# Altium project BYTE_SPIne.PrjPcb
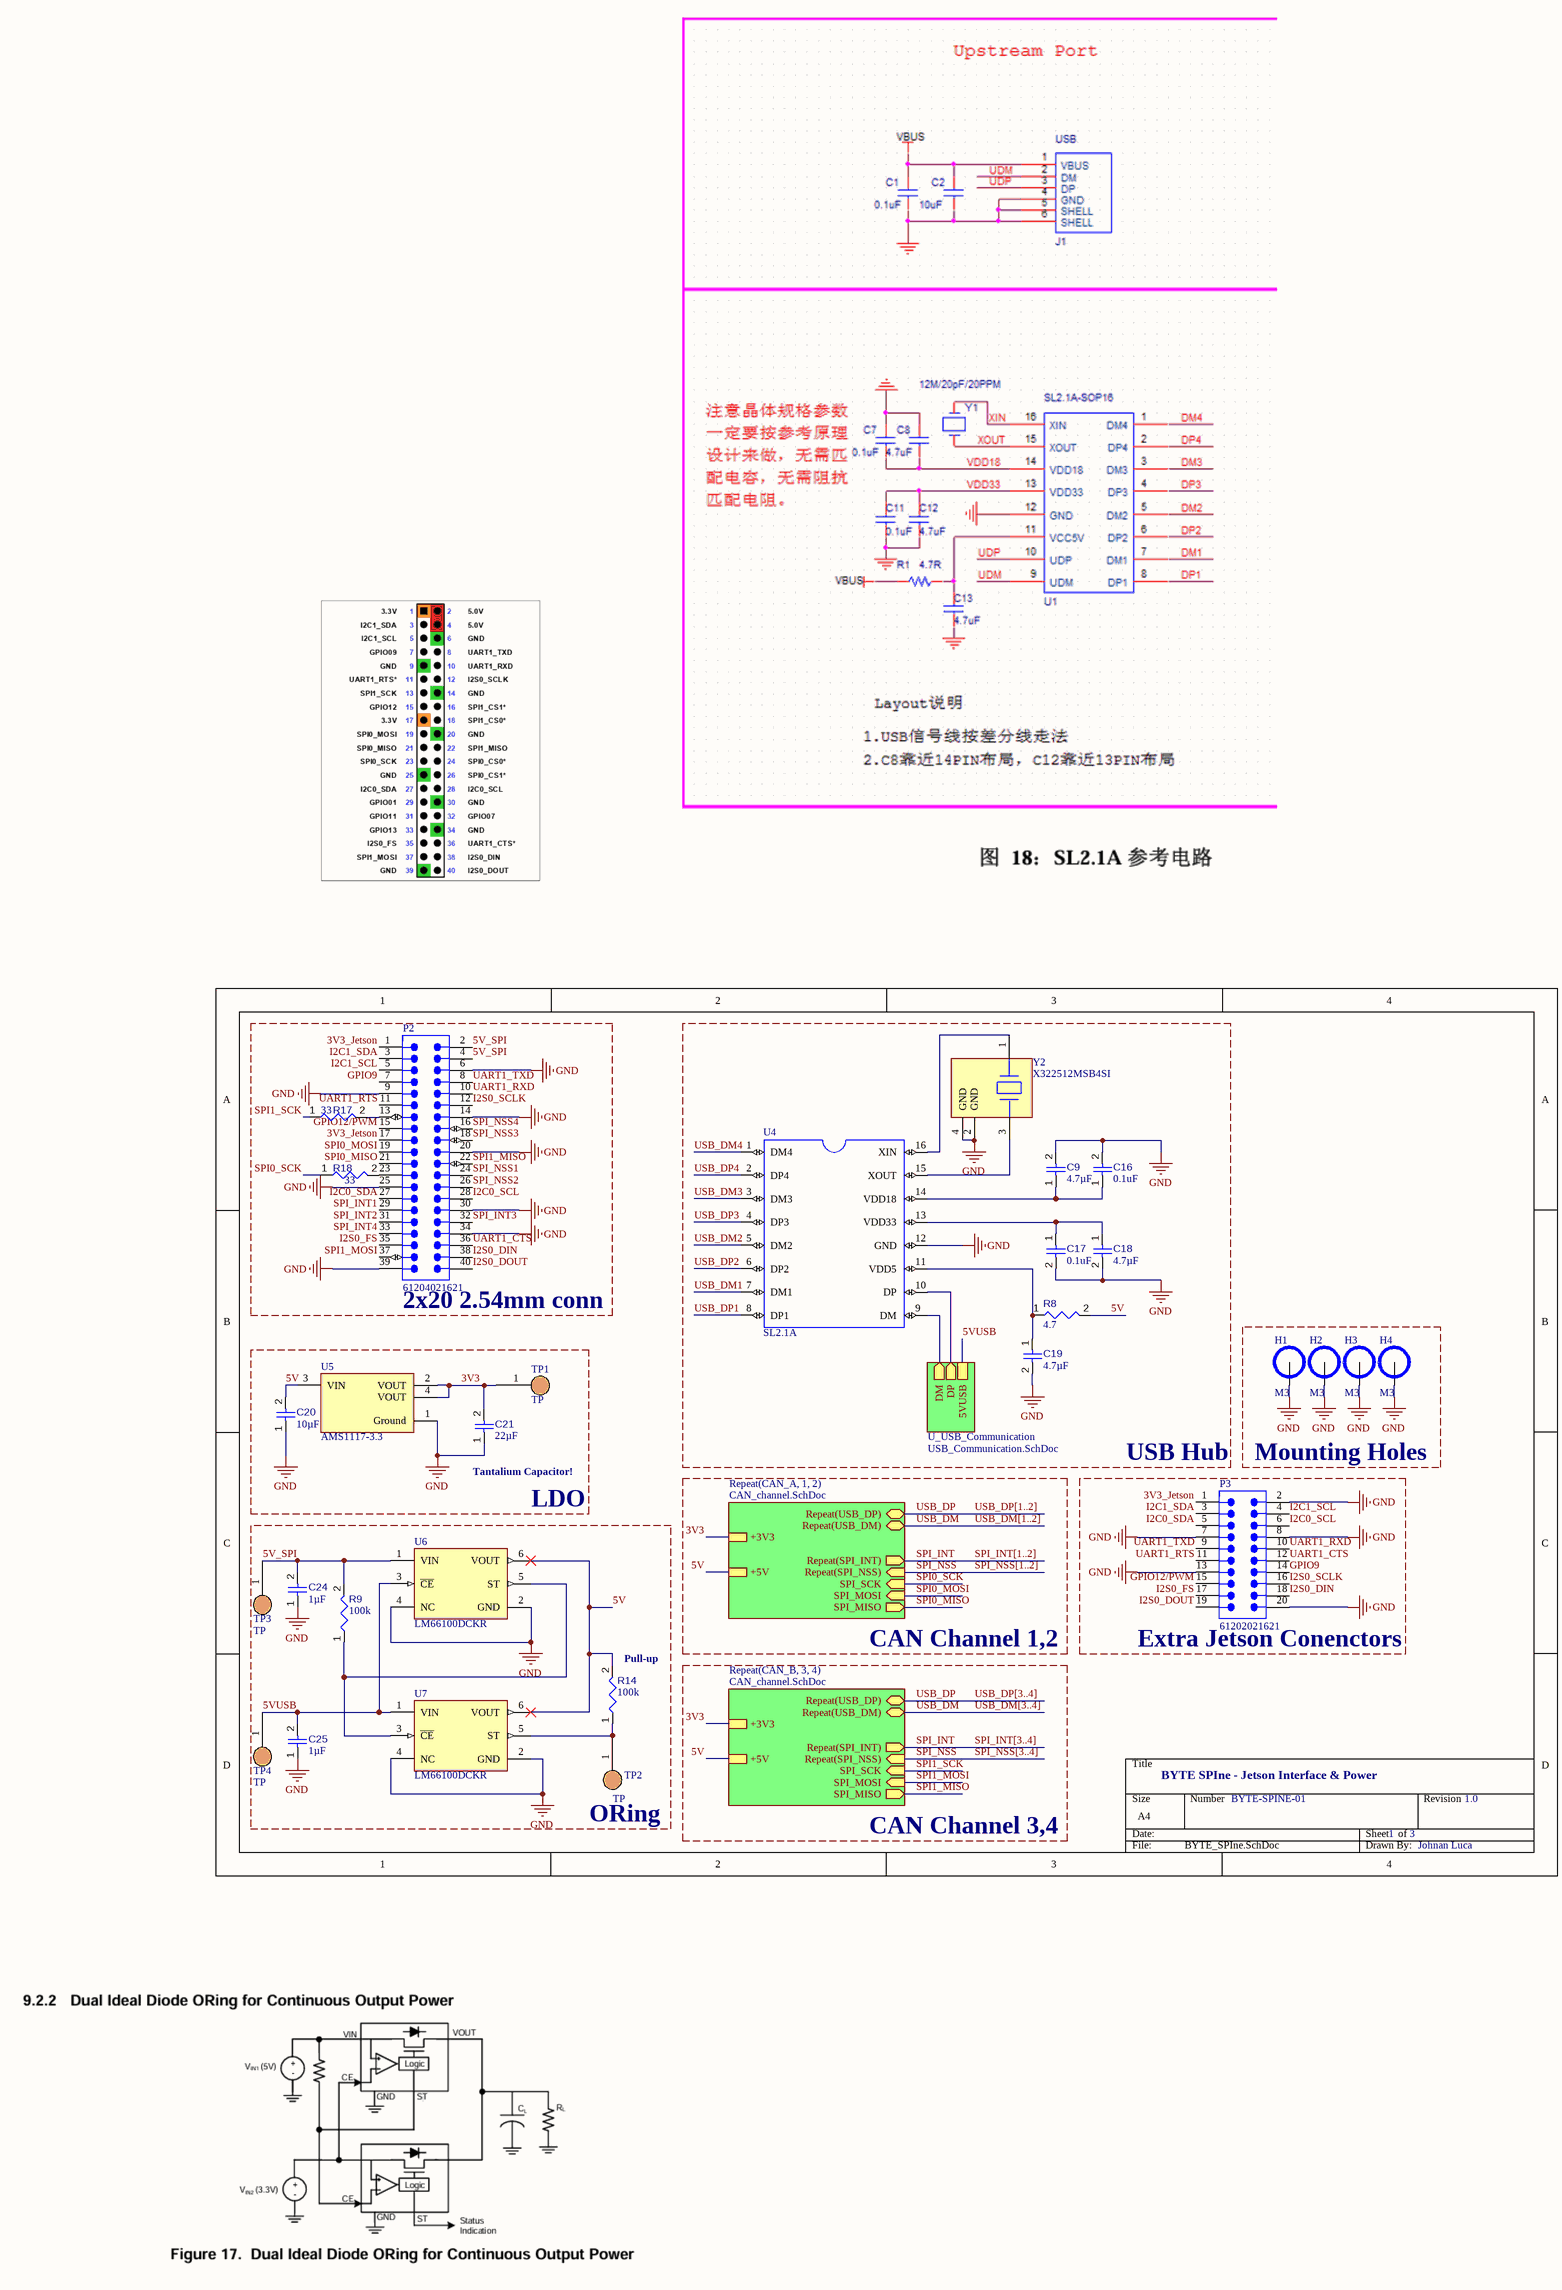
[diagram p0: BYTE_SPIne.SchDoc]
Company Name: AI Team - Robotics - BARK; DrawnBy: Johnan Luca; Revision: 1.0
3 sheets, 173 parts. Net scope: hierarchical (ports join the sheet entries above them; power ports are global).
Board file: BYTE_SPIne.PcbDoc
Sheets:
  BYTE_SPIne.SchDoc
    CAN_B3 = CAN_channel.SchDoc
    CAN_B4 = CAN_channel.SchDoc
    CAN_A1 = CAN_channel.SchDoc
    CAN_A2 = CAN_channel.SchDoc
    U_USB_Communication = USB_Communication.SchDoc

## Sheet BYTE_SPIne.SchDoc: BYTE SPIne - Jetson Interface & Power
size A4; DocumentNumber: BYTE-SPINE-01; SheetNumber: 1; SheetTotal: 3; LCSC: C6186

### Parts
C9  value 4.7µF  [CAPC0603(1608)100_L]  (hidden comment: 4.7uF)
C16  value 0.1uF  [CAPC0603(1608)100_L]  (hidden comment: 100nF)
C17  value 0.1uF  [CAPC0603(1608)100_L]  (hidden comment: 100nF)
C18  value 4.7µF  [CAPC0603(1608)100_L]  (hidden comment: 4.7uF)
C19  value 4.7µF  [CAPC0603(1608)100_L]  (hidden comment: 4.7uF)
C20  value 10µF  [CAPC0603(1608)100_L]  (hidden comment: 10uF)
C21  value 22µF  [CAPC0805(2012)145_L]  (hidden comment: 22uF)
C24  value 1µF  [CAPC1005X55X25LL05T10]  (hidden comment: 1uF)
C25  value 1µF  [CAPC1005X55X25LL05T10]  (hidden comment: 1uF)
H1  M3  [MH_M3_PTH]  (no BOM)
H2  M3  [MH_M3_PTH]  (no BOM)
H3  M3  [MH_M3_PTH]  (no BOM)
H4  M3  [MH_M3_PTH]  (no BOM)
P2  61204021621  [61204021621]  (no BOM)
P3  61202021621  [61202021621]  (no BOM)
R8  4.7  [RESC1608X55X25ML10T15]
R9  value 100k  [RESC0402(1005)_L]  (hidden comment: Resistor 100K +/-1 % 0402 63 mW)
R14  value 100k  [RESC0402(1005)_L]  (hidden comment: Resistor 100K +/-1 % 0402 63 mW)
R17  33  [RESC1608X55X25ML10T15]
R18  33  [RESC1608X55X25ML10T15]
TP1  TP  [TP_SMD_D1.5]  (no BOM)
TP2  TP  [TP_SMD_D1.5]  (no BOM)
TP3  TP  [TP_SMD_D1.5]  (no BOM)
TP4  TP  [TP_SMD_D1.5]  (no BOM)
U4  SL2.1A  [SO16]
U5  AMS1117-3.3  [FP-AMS1117-IPC_C]
U6  LM66100DCKR  [FP-DCK0006A-IPC_C]
U7  LM66100DCKR  [FP-DCK0006A-IPC_C]
Y2  X322512MSB4SI  [FP-ABM8-MFG]

### Blocks framed on the sheet
2x20 2.54mm conn: P2 R17 R18
USB Hub: C9 C16-C19 R8 U4 Y2
Mounting Holes: H1-H4
LDO: C20 C21 TP1 U5
ORing: C24 C25 R9 R14 TP2-TP4 U6 U7

### Sub-sheets
Repeat(CAN_A, 1, 2) = CAN_channel.SchDoc: Repeat(USB_DP) (bidir), Repeat(USB_DM) (bidir), +3V3, SPI_MISO (out), SPI_MOSI (in), SPI_SCK (in), Repeat(SPI_NSS) (in), Repeat(SPI_INT) (out), +5V
Repeat(CAN_B, 3, 4) = CAN_channel.SchDoc: Repeat(USB_DP) (bidir), Repeat(USB_DM) (bidir), +3V3, SPI_MISO (out), SPI_MOSI (in), SPI_SCK (in), Repeat(SPI_NSS) (in), Repeat(SPI_INT) (out), +5V
U_USB_Communication = USB_Communication.SchDoc: DP (out), DM (out), 5VUSB

### Nets
GND: C9.2 C16.2 C17.2 C18.2 C19.2 C20.1 C21.1 C24.1 C25.1 H1.1 H2.1 H3.1 H4.1 P2.6 P2.9 P2.14 P2.20 P2.25 P2.30 P2.34 P2.39 P3.2 P3.7 P3.8 P3.13 P3.20 U4.12(GND) U5.1(Ground) U6.2(GND) U6.4(NC) U7.2(GND) U7.4(NC) Y2.2(GND) Y2.4(GND)
3V3: C21.2 TP1.1 U5.2(VOUT) U5.4(VOUT) ; sheet Repeat(CAN_B, 3, 4)/+3V3, sheet Repeat(CAN_A, 1, 2)/+3V3
3V3_Jetson: P2.1 P2.17 P3.1
5V: C20.2 R8.2 R14.2 U5.3(VIN) U6.6(VOUT) U7.6(VOUT) ; sheet Repeat(CAN_B, 3, 4)/+5V, sheet Repeat(CAN_A, 1, 2)/+5V
5V_SPI: C24.2 P2.2 P2.4 R9.2 TP3.1 U6.1(VIN)
5VUSB: C25.2 TP4.1 U6.3(~{CE}) U7.1(VIN) ; sheet U_USB_Communication/5VUSB  [project net +5VUSB]
GPIO9: P2.7 P3.14
GPIO12/PWM: P2.15 P3.15
I2C0_SCL: P2.28 P3.6
I2C0_SDA: P2.27 P3.5
I2C1_SCL: P2.5 P3.4
I2C1_SDA: P2.3 P3.3
I2S0_DIN: P2.38 P3.18
I2S0_DOUT: P2.40 P3.19
I2S0_FS: P2.35 P3.17
I2S0_SCLK: P2.12 P3.16
SPI0_MISO: P2.21 ; sheet Repeat(CAN_A, 1, 2)/SPI_MISO
SPI0_MOSI: P2.19 ; sheet Repeat(CAN_A, 1, 2)/SPI_MOSI
SPI0_SCK: R18.1 ; sheet Repeat(CAN_A, 1, 2)/SPI_SCK
SPI1_MISO: P2.22 ; sheet Repeat(CAN_B, 3, 4)/SPI_MISO
SPI1_MOSI: P2.37 ; sheet Repeat(CAN_B, 3, 4)/SPI_MOSI
SPI1_SCK: R17.1 ; sheet Repeat(CAN_B, 3, 4)/SPI_SCK
SPI_INT: sheet Repeat(CAN_B, 3, 4)/Repeat(SPI_INT), sheet Repeat(CAN_A, 1, 2)/Repeat(SPI_INT)
SPI_INT1: P2.29
SPI_INT2: P2.31
SPI_INT3: P2.32
SPI_INT4: P2.33
SPI_NSS: sheet Repeat(CAN_B, 3, 4)/Repeat(SPI_NSS), sheet Repeat(CAN_A, 1, 2)/Repeat(SPI_NSS)
SPI_NSS1: P2.24
SPI_NSS2: P2.26
SPI_NSS3: P2.18
SPI_NSS4: P2.16
UART1_CTS: P2.36 P3.12
UART1_RTS: P2.11 P3.11
UART1_RXD: P2.10 P3.10
UART1_TXD: P2.8 P3.9
USB_DM: sheet Repeat(CAN_B, 3, 4)/Repeat(USB_DM), sheet Repeat(CAN_A, 1, 2)/Repeat(USB_DM)
USB_DM1: U4.7(DM1)
USB_DM2: U4.5(DM2)
USB_DM3: U4.3(DM3)
USB_DM4: U4.1(DM4)
USB_DP: sheet Repeat(CAN_B, 3, 4)/Repeat(USB_DP), sheet Repeat(CAN_A, 1, 2)/Repeat(USB_DP)
USB_DP1: U4.8(DP1)
USB_DP2: U4.6(DP2)
USB_DP3: U4.4(DP3)
USB_DP4: U4.2(DP4)
NetC9_1: C9.1 C16.1 U4.14(VDD18)
NetC17_1: C17.1 C18.1 U4.13(VDD33)
NetC19_1: C19.1 R8.1 U4.11(VDD5)
NetP2_13: P2.13 R17.2
NetP2_23: P2.23 R18.2
NetR9_1: R9.1 U6.5(ST) U7.3(~{CE})
NetR14_1: R14.1 TP2.1 U7.5(ST)
NetU3_1: U4.10(DP) ; sheet U_USB_Communication/DP
NetU3_3: U4.9(DM) ; sheet U_USB_Communication/DM
NetU4_15: U4.15(XOUT) Y2.3
NetU4_16: U4.16(XIN) Y2.1

### Buses and harness runs
bus SPI_INT[1..2]
bus SPI_INT[3..4]
bus SPI_NSS[1..2]
bus SPI_NSS[3..4]
bus USB_DM[1..2]
bus USB_DM[3..4]
bus USB_DP[1..2]
bus USB_DP[3..4]

### Notes on the sheet
- (near C21) Tantalium Capacitor!
- (near R14) Pull-up
- CAN Channel 1,2
- (near P3) Extra Jetson Conenctors
- CAN Channel 3,4

### Library data of the parts
C9 C16-C19 = CMP-001-00076-4: 0603; Tolerance: 10%; Voltage Rating: 10V; Mounting Technology: SMT; Case/Package: 0603; Pins: 2; Min Operating Temperature: -55°C; Max Operating Temperature: 85°C
  C9 C18 C19: LCSC: C19666
  C16 C17: LCSC: C14663
C20 = CMP-001-00075-4: 0603; Voltage Rating: 10V; Tolerance: 10%; Max Operating Temperature: 85°C; Pins: 2; Case/Package: 0603; Mounting Technology: SMT; Min Operating Temperature: -55°C; LCSC: C19702
C21 = CMP-001-00081-4: 0805; Voltage Rating: 16V; Tolerance: 5%; Mounting Technology: SMT; Pins: 2; Max Operating Temperature: 85°C; Case/Package: 0805; Min Operating Temperature: -55°C; LCSC: C45783
C24 C25 = CMP-001-00008-6: 0402; Tolerance: 10%; Capacitor Type: Ceramic; Voltage Rating: 6.3V; Max Operating Temperature: 85°C; Mounting Technology: SM; Case/Package: 0402; RoHS Compliant: True; Min Operating Temperature: -55°C; Pins: 2; LCSC: C52923
H1-H4 = MH_M3_PTH
P2 = CMP-1502-00015-4: WR-BHD Straight Male, Box Header, Through Hole, 2 Rows, 40 Contacts, 2.54mm Pitch; Number of Positions: 40; Contact Resistance: 20mΩ; Current Rating: 3A; Connector Type: Male Pin; Operating Supply Voltage: 250V; Insulation Resistance: 1GΩ; Color: Black; Row Spacing: 2.54mm; Pitch: 2.54mm; RoHS: Compliant; Max Operating Temperature: 105°C; Insulation Material: PBT; Number of Pins: 40; Contact Plating: Gold; Orientation: Vertical; Voltage Rating: 250V; Number of Rows: 2; Lead Pitch: 2.54mm; Length: 58.46mm; Mount: Through Hole; Gender: Male; Number of Contacts: 40; Height: 9.25mm; Min Operating Temperature: -40°C; Contact Material: Gold; Termination: Solder; REACH SVHC: Unknown
P3 = CMP-1502-00010-3: WR-BHD Straight Male, Box Header, Through Hole, 2 Rows, 20 Contacts, 2.54mm Pitch; Insulation Resistance: 1GΩ; Number of Contacts: 20; Current Rating: 3A; Voltage Rating: 250V; Connector Type: Male Pin; Contact Resistance: 20mΩ; Insulation: Insulated; Mount: Through Hole; Length: 33.06mm; Min Operating Temperature: -40°C; Orientation: Vertical; Number of Rows: 2; Width: 33.06mm; Row Spacing: 2.54mm; Flammability Rating: UL94 V-0; Contact Gender: Male; Lead Pitch: 2.54mm; Housing Material: PBT; Voltage Rating (DC): 250V; Pitch: 2.54mm; Termination: Through Hole; Number of Pins: 20; RoHS: Compliant; Insulation Material: PBT; Gender: Male; Contact Material: Gold; Number of Positions: 20; Max Operating Temperature: 105°C; Operating Supply Voltage: 250V; Height: 9.25mm; Contact Plating: Gold; Color: Black
R8 = CMP-009-00031-5: 0603; Tolerance: 1%; Power: 100mW; Mounting Technology: SM; Case/Package: 0603; Value: 4.7; RoHS Compliant: True; Pins: 2; Min Operating Temperature: -55°C; Max Operating Temperature: 155°C; LCSC: C23164
R9 R14 = CMP-009-00168-3: Chip Resistor, 100 kOhms, +/-1 %, 63 mW, -55 to 155 degC, 0402; Tolerance: 1%; Power: 63mW; Max Operating Temperature: 155°C; Min Operating Temperature: -55°C; Pins: 2; Case/Package: 0402; LCSC: C25741
R17 R18 = CMP-009-00031-5: Tolerance: 1%; Power: 100mW; Mounting Technology: SM; Case/Package: 0603; Value: 33; RoHS Compliant: True; Pins: 2; Min Operating Temperature: -55°C; Max Operating Temperature: 155°C; LCSC: C23140
TP1-TP4 = TP_SMD_D1.5
U4 = SL2.1A: USB 2.0 HIGH SPEED 4-PORT HUB CONTROLLER; MF: CoreChips ShenZhen CO.,Ltd; SnapEDA_Link: https://www.snapeda.com/parts/SL2.1A/CoreChips+ShenZhen+CO.%252CLtd/view-part/?ref=snap; Package: Package; Value: *; MP: SL2.1A; Check_prices: https://www.snapeda.com/parts/SL2.1A/CoreChips+ShenZhen+CO.%252CLtd/view-part/?ref=eda; LCSC: C6798314
U5 = CMP-209535-000001-1: LDO Voltage Regulators 1A, 3.3V; Manufacturer: Advanced Monolithic Systems; Dropout Voltage: 1.1V; Output Type: Fixed; Nominal Supply Current: 5mA; Max Power Dissipation: 1.2W; Max Supply Voltage: 15V; Number Of Outputs: 1; Standoff Height: 0.64mm; Max Junction Temp: +125°C; Height: 1.8mm; Package: AMS1117; Device Class L2: Power Management ICs; ComponentLink2Description: Datasheet; ComponentLink2URL: http://www.advanced-monolithic.com/pdf/ds1117.pdf; Category: IC; RoHS: TRUE; Automotive: No; Device Class L1: Integrated Circuits (ICs); Output Current: 1A; Device Class L3: Voltage Regulators - Linear; Temperature: -40°C to +125°C; Output Voltage: 3.3V; Manufacturer Part Number: AMS1117-3.3; Temperature Range Low: -40°C; Octopart: https://octopart.com/ams1117-3.3-advanced+monolithic+systems-25899300; Lead Free: Yes; Ipc Land Pattern Name: SOT229P700X180-4; Temperature Range High: +125°C; LCSC: C6186
U6 U7 = CMP-04910-000059-1: IC OR CTRLR IDEAL DIODE SC70-6; LCSC: C2869734
Y2 = CMP-27762-003220-1: Operating Frequency: 12 MHz; Tolerance: 20ppm; Load Capacitance: 18pF; ESR (Equivalent Series Resistance): 120R; Frequency Stability: 50ppm; Frequency: 12MHz; Resistor Type: Ceramic; Frequency Tolerance: 20ppm; Packaging: Tape and Reel; Number of Pins: 4; Case/Package: CSMD; Max Operating Temperature: 70°C; Mount: Surface Mount; Package Quantity: 1000; Radiation Hardening: No; Min Operating Temperature: -20°C; Width: 0.098inch; Lead Free: Lead Free; Height: 0.031inch; Depth: 2.5mm; REACH SVHC: No SVHC; Series: ABM8; Series Resistance: 120R; Length: 3.2mm; Termination: SMD/SMT; RoHS Compliant: Yes; LCSC: C9002

## Sheet CAN_channel.SchDoc: BYTE SPIne - CAN Channel (STM32F072 + TCAN1042)
size A4; DocumentNumber: BYTE-SPINE-02; SheetNumber: 2; SheetTotal: 3
Used 4 times, as channels CAN_B3, CAN_B4, CAN_A1, CAN_A2. Parts and nets are listed once, with the designators drawn on the sheet.
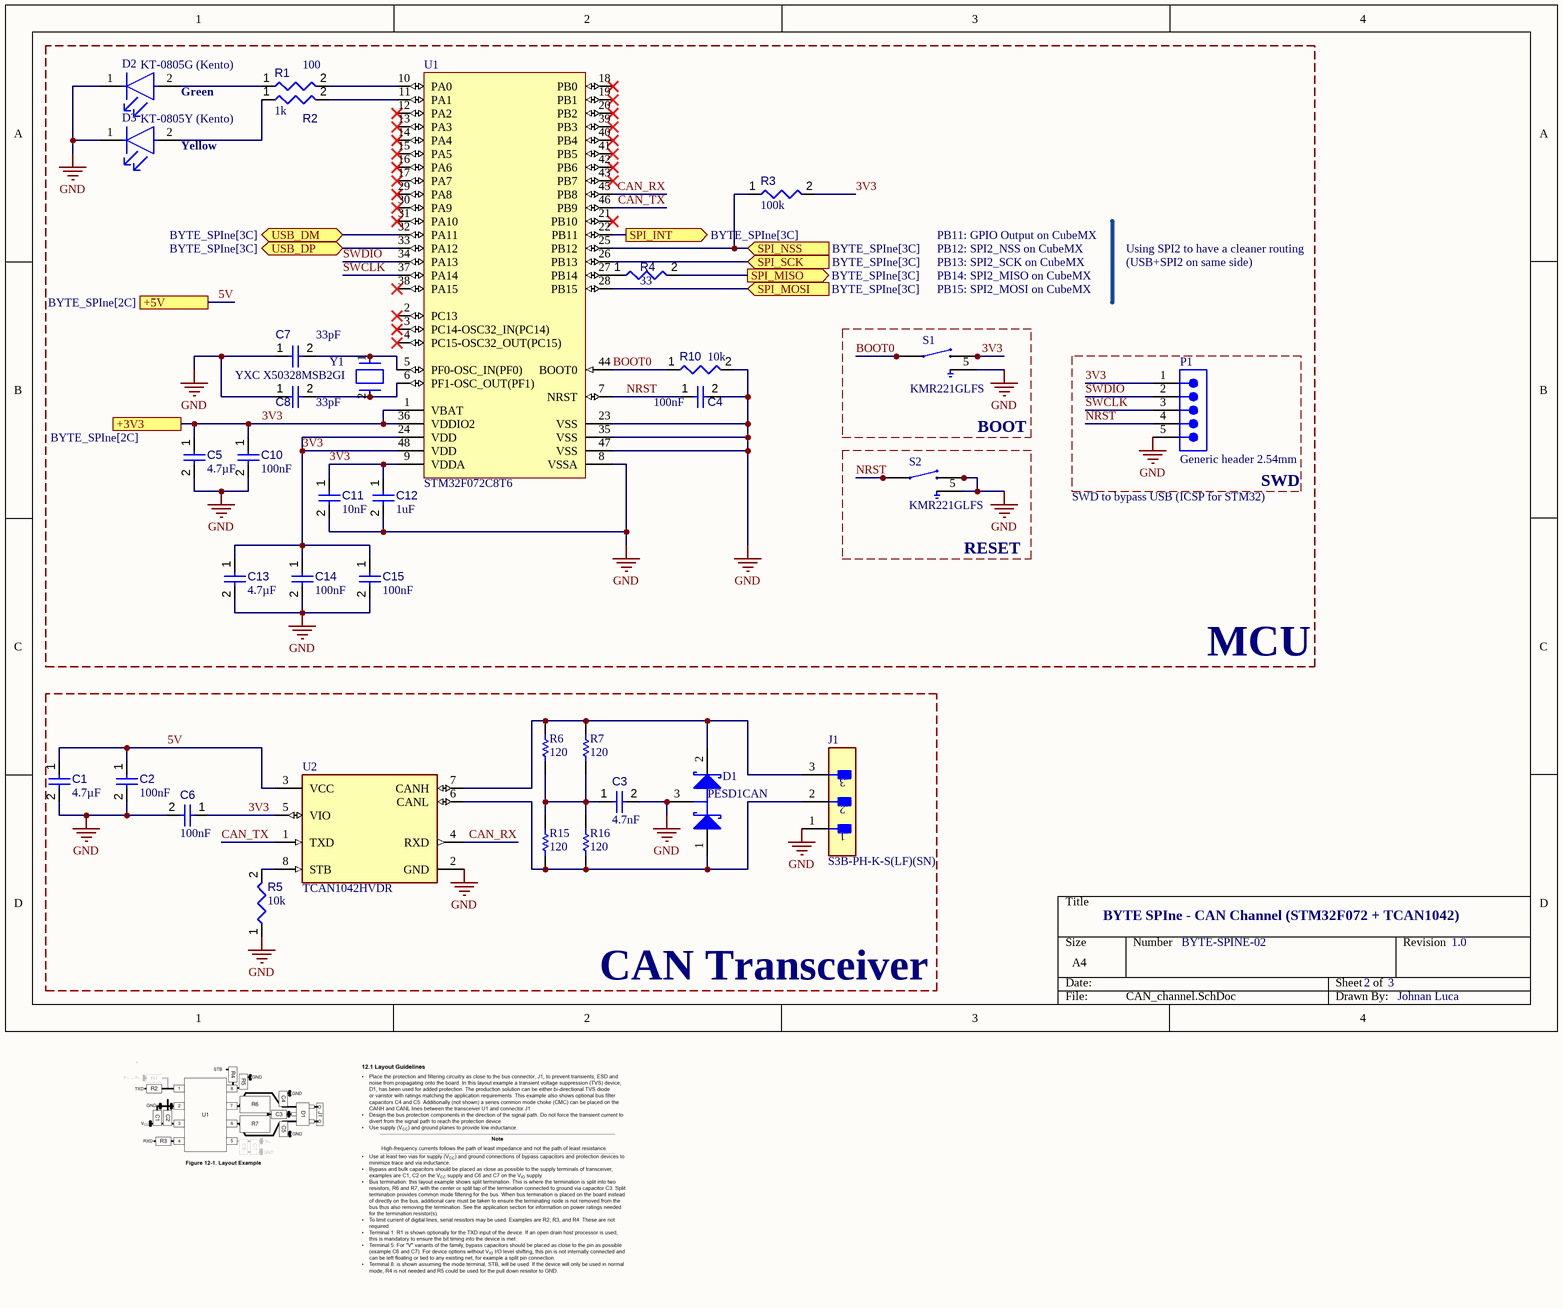
[diagram p1: CAN_channel.SchDoc]

### Parts
C1  value 4.7µF  [CAPC0603(1608)100_L]  (hidden comment: 4.7uF)
C2  100nF  [CAPC1608X90X40NL10T20]
C3  4.7nF  [CAPC1608X90X40NL10T20]
C4  100nF  [CAPC1608X90X40NL10T20]
C5  value 4.7µF  [CAPC0603(1608)100_L]  (hidden comment: 4.7uF)
C6  100nF  [CAPC1608X90X40NL10T20]
C7  33pF  [CAPC0402(1005)60_L]
C8  33pF  [CAPC0402(1005)60_L]
C10  100nF  [CAPC1608X90X40NL10T20]
C11  10nF  [CAPC1608X90X40NL10T20]
C12  1uF  [CAPC1608X90X40NL10T20]
C13  value 4.7µF  [CAPC0603(1608)100_L]  (hidden comment: 4.7uF)
C14  100nF  [CAPC1608X90X40NL10T20]
C15  100nF  [CAPC1608X90X40NL10T20]
D1  PESD1CAN  [FAIR-SOT23-3_V]
D2  KT-0805G (Kento)  [FP-LTST-C170GKT-MFG]
D3  KT-0805Y (Kento)  [FP-LTST-C170GKT-MFG]
J1  S3B-PH-K-S(LF)(SN)  [FP-S3B-PH-K-S_LF_SN-MFG]  (no BOM)
P1  Generic header 2.54mm  [61300511121]  (no BOM)
R1  100  [RESC0402(1005)_L]
R2  1k  [RESC0402(1005)_L]
R3  100k  [RESC1608X55X25ML10T15]
R4  33  [RESC1608X55X25ML10T15]
R5  10k  [RESC1608X55X25ML10T15]
R6  120  [RESC3116X70X50ML13T20]
R7  120  [RESC3116X70X50ML13T20]
R10  10k  [RESC1608X55X25ML10T15]
R15  120  [RESC3116X70X50ML13T20]
R16  120  [RESC3116X70X50ML13T20]
S1  KMR221GLFS  [SW_KMR221GLFS]
S2  KMR221GLFS  [SW_KMR221GLFS]
U1  STM32F072C8T6  [STM-LQFP48_M]
U2  TCAN1042HVDR  [FP-D0008B-IPC_B]
Y1  YXC X50328MSB2GI  [FP-ABM3-MFG]

### Blocks framed on the sheet
MCU: C4 C5 C7 C8 C10-C15 D2 D3 R1-R4 R10 U1 Y1
BOOT: S1
SWD: P1
RESET: S2
CAN Transceiver: C1-C3 C6 D1 J1 R5-R7 R15 R16 U2

### Ports
+3V3 (see BYTE_SPIne[2C]), +5V (see BYTE_SPIne[2C]), SPI_INT (out, see BYTE_SPIne[3C]), SPI_MISO (out, see BYTE_SPIne[3C]), SPI_MOSI (in, see BYTE_SPIne[3C]), SPI_NSS (in, see BYTE_SPIne[3C]), SPI_SCK (in, see BYTE_SPIne[3C]), USB_DM (bidir, see BYTE_SPIne[3C]), USB_DP (bidir, see BYTE_SPIne[3C])

### Nets
GND: C1.2 C2.2 C3.2 C4.2 C5.2 C6.2 C7.1 C8.1 C10.2 C11.2 C12.2 C13.2 C14.2 C15.2 D1.3(C) D2.1(C) D3.1(C) J1.1 P1.5 R5.1 R10.2 S1.5 S2.2 S2.3 S2.5 U1.8(VSSA) U1.23(VSS) U1.35(VSS) U1.47(VSS) U2.2(GND)
3V3: C5.1 C6.1 C10.1 C11.1 C12.1 C13.1 C14.1 C15.1 P1.1 R3.2 S1.2 S1.3 U1.1(VBAT) U1.9(VDDA) U1.24(VDD) U1.36(VDDIO2) U1.48(VDD) U2.5(VIO) ; port +3V3
5V: C1.1 C2.1 U2.3(VCC) ; port +5V
BOOT0: R10.1 S1.1 S1.4 U1.44(BOOT0)
CAN_RX: U1.45(PB8) U2.4(RXD)
CAN_TX: U1.46(PB9) U2.1(TXD)
NRST: C4.1 P1.4 S2.1 S2.4 U1.7(NRST)
SPI_INT: U1.22(PB11) ; port SPI_INT
SPI_MISO: R4.2 ; port SPI_MISO
SPI_MOSI: U1.28(PB15) ; port SPI_MOSI
SPI_NSS: R3.1 U1.25(PB12) ; port SPI_NSS
SPI_SCK: U1.26(PB13) ; port SPI_SCK
SWCLK: P1.3 U1.37(PA14)
SWDIO: P1.2 U1.34(PA13)
USB_DM: U1.32(PA11) ; port USB_DM
USB_DP: U1.33(PA12) ; port USB_DP
NetC3_1: C3.1 R6.1 R7.1 R15.2 R16.2
NetC7_2: C7.2 U1.5(PF0-OSC_IN(PF0)) Y1.1
NetC8_2: C8.2 U1.6(PF1-OSC_OUT(PF1)) Y1.2
NetD1_1: D1.1(A) J1.2 R15.1 R16.1 U2.6(CANL)
NetD1_2: D1.2(K) J1.3 R6.2 R7.2 U2.7(CANH)
NetD2_2: D2.2(A) R1.1
NetD3_2: D3.2(A) R2.1
NetR1_2: R1.2 U1.10(PA0)
NetR2_2: R2.2 U1.11(PA1)
NetR4_1: R4.1 U1.27(PB14)
NetR5_2: R5.2 U2.8(STB)

Not connected (* = marked no-connect by the designer): U1 2(PC13)* 3(PC14-OSC32_IN(PC14))* 4(PC15-OSC32_OUT(PC15))* 12(PA2)* 13(PA3)* 14(PA4)* 15(PA5)* 16(PA6)* 17(PA7)* 18(PB0)* 19(PB1)* 20(PB2)* 21(PB10)* 29(PA8)* 30(PA9)* 31(PA10)* 38(PA15)* 39(PB3)* 40(PB4)* 41(PB5)* 42(PB6)* 43(PB7)*

### Channels
CAN_B3: designators end in _CAN_B3; ports +3V3=3V3 +5V=5V SPI_INT=SPI_INT3 SPI_MISO=SPI1_MISO SPI_MOSI=SPI1_MOSI SPI_NSS=SPI_NSS3 SPI_SCK=SPI1_SCK USB_DM=USB_DM3 USB_DP=USB_DP3
CAN_B4: designators end in _CAN_B4; ports +3V3=3V3 +5V=5V SPI_INT=SPI_INT4 SPI_MISO=SPI1_MISO SPI_MOSI=SPI1_MOSI SPI_NSS=SPI_NSS4 SPI_SCK=SPI1_SCK USB_DM=USB_DM4 USB_DP=USB_DP4
CAN_A1: designators end in _CAN_A1; ports +3V3=3V3 +5V=5V SPI_INT=SPI_INT1 SPI_MISO=SPI0_MISO SPI_MOSI=SPI0_MOSI SPI_NSS=SPI_NSS1 SPI_SCK=SPI0_SCK USB_DM=USB_DM1 USB_DP=USB_DP1
CAN_A2: designators end in _CAN_A2; ports +3V3=3V3 +5V=5V SPI_INT=SPI_INT2 SPI_MISO=SPI0_MISO SPI_MOSI=SPI0_MOSI SPI_NSS=SPI_NSS2 SPI_SCK=SPI0_SCK USB_DM=USB_DM2 USB_DP=USB_DP2

### Notes on the sheet
- (near D2) Green
- (near D3) Yellow
- PB11: GPIO Output on CubeMX
- PB12: SPI2_NSS on CubeMX
- Using SPI2 to have a cleaner routing
- PB13: SPI2_SCK on CubeMX
- PB14: SPI2_MISO on CubeMX
- PB15: SPI2_MOSI on CubeMX
- (USB+SPI2 on same side)
- SWD to bypass USB (ICSP for STM32)

### Library data of the parts
C1 C5 C13 = CMP-001-00076-4: as C9 on sheet BYTE_SPIne; Mounting Technology: SMT; Case/Package: 0603; Pins: 2; Min Operating Temperature: -55°C; Max Operating Temperature: 85°C; LCSC: C19666
C2-C4 C6 C10-C12 C14 C15 = CMP-001-00017-6: 0603; Tolerance: 10%; Voltage Rating: 50V; Capacitor Type: Ceramic; Mounting Technology: SM; Max Operating Temperature: 125°C; RoHS Compliant: True; Pins: 2; Case/Package: 0603; Min Operating Temperature: -55°C
  C2 C4 C6 C10 C14 C15: Value: 100nF; LCSC: C14663
  C3: Value: 4.7nF; LCSC: C53987
  C11: Value: 10nF; LCSC: C57112
  C12: Value: 1uF; LCSC: C15849
C7 = CMP-001-00073-3: Chip Capacitor, 33 pF +/-10%, 50V, 0402, Thickness 0.6 mm; Tolerance: 10%; Pins: 2; Voltage Rating: 50V; Max Operating Temperature: 85°C; Min Operating Temperature: -55°C; Mounting Technology: SMT; Case/Package: 0402; Value: 33pF; LCSC: C1562
C8 = CMP-001-00073-3: 0402; Voltage Rating: 50V; Tolerance: 10%; Pins: 2; Max Operating Temperature: 85°C; Min Operating Temperature: -55°C; Mounting Technology: SMT; Case/Package: 0402; Value: 33pF; LCSC: C1562
D1 = CMP-004-00013-2: Package Reference: SOT23-3; Pins: 3; Case/Package: SOT-23; LCSC: C15771
D2 = CMP-1674-00002-6: LED GREEN CLEAR SMD; Dominant Wavelength: 569nm; Lens Style: Diffused; Forward Voltage: 2.1V; Number of Elements: 1; Wavelength: 565nm; Luminous Intensity: 6mcd; Test Current: 10mA; Power Dissipation: 100mW; Reverse Voltage: 5V; Forward Current: 30mA; Viewing Angle: 130°; Lens Color: Colorless; Min Operating Temperature: -55°C; Number of Pins: 2; Max Operating Temperature: 85°C; Color: Green; Radiation Hardening: No; Illumination Color: Green; Case Code (Metric): 2012; Lens Transparency: Clear; Case/Package: 0805; Width: 1.25mm; Case Code (Imperial): 0805; Package Quantity: 1; Height: 1.1mm; Depth: 1.25mm; Length: 2mm; Power Rating: 100mW; Lead Free: Lead Free; Number of LEDs: 1; Packaging: Tape and Reel; Mount: Surface Mount; Voltage: 5V; LCSC: C2297
D3 = CMP-1674-00002-6: LED YELLOW CLEAR SMD; Dominant Wavelength: 569nm; Lens Style: Diffused; Forward Voltage: 2.1V; Number of Elements: 1; Color: Green; Wavelength: 565nm; Luminous Intensity: 6mcd; Test Current: 10mA; Power Dissipation: 100mW; Reverse Voltage: 5V; Forward Current: 30mA; Viewing Angle: 130°; Lens Color: Colorless; Min Operating Temperature: -55°C; Number of Pins: 2; Max Operating Temperature: 85°C; Radiation Hardening: No; Illumination Color: Green; Case Code (Metric): 2012; Lens Transparency: Clear; Case/Package: 0805; Width: 1.25mm; Case Code (Imperial): 0805; Package Quantity: 1; Height: 1.1mm; Depth: 1.25mm; Length: 2mm; Power Rating: 100mW; Lead Free: Lead Free; Number of LEDs: 1; Packaging: Tape and Reel; Mount: Surface Mount; Voltage: 5V; LCSC: C2296
J1 = CMP-17439-000039-1: CONN HEADER R/A 3POS 2MM; Height: 0.31inch; Weight: 0.0625lb; Length: 0.31inch; Width: 0.31inch
P1 = CMP-1502-01068-4: THT Vertical Pin Header WR-PHD, Pitch 2.54 mm, Single Row, 5 pins; Number of Contacts: 5; Connector Type: Male Pin; Operating Supply Voltage: 250V; Contact Resistance: 20mΩ; Gender: Male; Current Rating: 3A; Min Operating Temperature: -40°C; Contact Material: Gold; Color: Black; Pitch: 2.54mm; RoHS: Compliant; Number of Rows: 1; Lead Free: Lead Free; Height: 8.89mm; Contact Plating: Gold; Number of Pins: 5; Orientation: Vertical; Voltage Rating: 250V; Packaging: Bulk; Number of Positions: 5; Max Operating Temperature: 105°C; Termination: Solder; Lead Pitch: 2.54mm; Contact Mating Length: 5.9944mm; Mount: Through Hole
R1 R2 = CMP-009-00114-3: Power: 63mW; Tolerance: 5%; Pins: 2; Mounting Technology: SMT; Case/Package: 0402
  R1: Value: 100; LCSC: C25076
  R2: Value: 1k; LCSC: C11702
R3-R5 R10 = CMP-009-00031-5: Tolerance: 1%; Power: 100mW; Mounting Technology: SM; Case/Package: 0603; RoHS Compliant: True; Pins: 2; Min Operating Temperature: -55°C; Max Operating Temperature: 155°C
  R3: Value: 100k; LCSC: C25803
  R4: Value: 33; LCSC: C23140
  R5 R10: Value: 10k; LCSC: C25804
R6 R7 R15 R16 = CMP-009-00011-5: 1206; Tolerance: 1%; Voltage Rating: 200V; Power: 250mW; Max Operating Temperature: 155°C; Mounting Technology: SM; Case/Package: 1206; RoHS Compliant: True; Min Operating Temperature: -55°C; Value: 120; Pins: 2; LCSC: C17909
S1 S2 = KMR221GLFS: Switch Tactile N.O. SPST Button Gull Wing 0.05A 32VDC 1VA 200000Cycles 2N SMD Automotive T/R; MF: CK; SnapEDA_Link: https://www.snapeda.com/parts/KMR221G%20LFS/C%2526K/view-part/?ref=snap; Package: None; Value: *; MP: KMR221G LFS; Check_prices: https://www.snapeda.com/parts/KMR221G%20LFS/C%2526K/view-part/?ref=eda; LCSC: C72443
U1 = CMP-0304-00166-4: ARM Cortex-M0 32-bit MCU, 64 KB Flash, 16 KB Internal RAM, 37 I/Os, 48-Pin LQFP, -40 to 85 degC, Tray; Manufacturer: STMicroelectronics; Operating Frequency(F) (Processor speed) (MHz): 48; FLASH Size (Prog) (kB): 64; I/Os (High Current): 37; D/A Converter: 1; Internal RAM Size (kB): 16; Supply Voltage(Vcc) min (V): 2; Package Reference: LQFP48; DatasheetVersion: Rev. 5; Core: ARM Cortex-M0; ComponentLink1Description: Manufacturer URL; ComponentLink1URL: http://www.st.com/; Packing: Tray; Mounting Technology: Surface Mount; Package Description: 48-Pin Low Profile Quad Flat Package, Body 7 x 7 mm, Pitch 0.5 mm; ComponentLink2URL: http://www.st.com/st-web-ui/static/active/en/resource/technical/document/datasheet/DM00090510.pdf; ComponentLink2Description: Datasheet; PartNumber: STM32F072C8T6; LCSC: C80488
U2 = CMP-04872-000069-1: IC TRANSCEIVER 1/1 8SOIC; Number of Transmit Buffers: 1; Data Rate: 2Mbps; Max Supply Voltage: 5.5V; Receiver Hysteresis: 120mV; Min Supply Voltage: 4.5V; Mount: Surface Mount; Max Operating Temperature: 125°C; REACH SVHC: No SVHC; Lead Free: Lead Free; RoHS Compliant: Yes; Number of Pins: 8; Packaging: Cut Tape; Case/Package: SOIC; Min Operating Temperature: -55°C; Number of Receive Buffers: 1; LCSC: C127869
Y1 = CMP-2000-05033-2: Load Capacitance: 18pF; Tolerance: 20ppm; Frequency: 8MHz; Series Resistance: 500R; Frequency Stability: 30ppm; ESR (Equivalent Series Resistance): 140R; Height: 0.051inch; Depth: 3.2mm; Max Operating Temperature: 85°C; Termination: SMD/SMT; Lead Free: Lead Free; Number of Pins: 2; Width: 3.2mm; RoHS Compliant: Yes; Resistor Type: Ceramic; Length: 5mm; Mount: Surface Mount; Case/Package: CSMD; Package Quantity: 1000; Radiation Hardening: No; Min Operating Temperature: -40°C; Packaging: Tape and Reel; Frequency Tolerance: 20ppm; LCSC: C115962

## Sheet USB_Communication.SchDoc: BYTE SPIne - USB-C & 4-Port Hub
size A4; DocumentNumber: BYTE-SPINE-03; SheetNumber: 3; SheetTotal: 3; LCSC: C165948
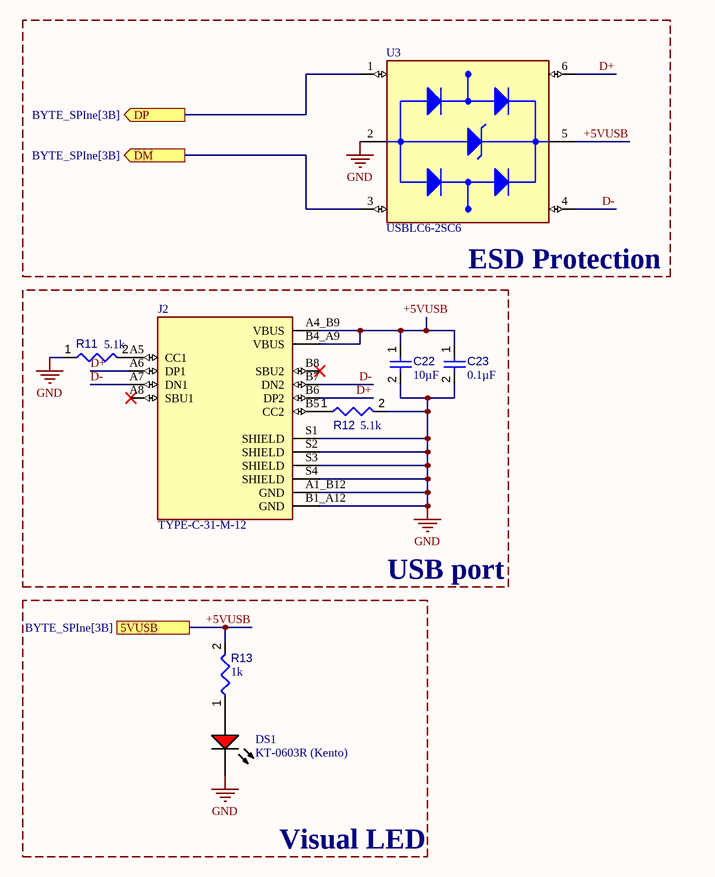
[diagram p2: USB_Communication.SchDoc]

### Parts
C22  value 10µF  [CAPC0603(1608)100_L]  (hidden comment: 10uF)
C23  value 0.1µF  [CAPC0603(1608)100_L]  (hidden comment: 100nF)
DS1  KT-0603R (Kento)  [AVAG-HSMX-C190_V]
J2  TYPE-C-31-M-12  [HRO_TYPE-C-31-M-12]
R11  5.1k  [RESC1608X55X25ML10T15]
R12  5.1k  [RESC1608X55X25ML10T15]
R13  1k  [RESC1608X55X25ML10T15]
U3  USBLC6-2SC6  [SOT95P280X145-6N]

### Blocks framed on the sheet
ESD Protection: U3

### Ports
5VUSB (see BYTE_SPIne[3B]), DM (out, see BYTE_SPIne[3B]), DP (out, see BYTE_SPIne[3B])

### Nets
GND: C22.2 C23.2 DS1.2(K) J2.A1_B12(GND) J2.B1_A12(GND) J2.S1(SHIELD) J2.S2(SHIELD) J2.S3(SHIELD) J2.S4(SHIELD) R11.1 R12.2 U3.2(GND)
+5VUSB: C22.1 C23.1 J2.A4_B9(VBUS) J2.B4_A9(VBUS) R13.2 U3.5(VBUS) ; port 5VUSB
D+: J2.A6(DP1) J2.B6(DP2) U3.6(I/O1_OUT)
D-: J2.A7(DN1) J2.B7(DN2) U3.4(I/O2_OUT)
NetDS1_1: DS1.1(A) R13.1
NetJ2_A5: J2.A5(CC1) R11.2
NetJ2_B5: J2.B5(CC2) R12.1
NetU3_1: U3.1(I/O1_IN) ; port DP
NetU3_3: U3.3(I/O2_IN) ; port DM

Not connected (* = marked no-connect by the designer): J2 A8(SBU1)* B8(SBU2)*

### Notes on the sheet
- USB port
- Visual LED

### Library data of the parts
C22 C23 = CMP-001-00075-4: as C20 on sheet BYTE_SPIne; Max Operating Temperature: 85°C; Pins: 2; Case/Package: 0603; Mounting Technology: SMT; Min Operating Temperature: -55°C
  C22: LCSC: C19702
  C23: LCSC: C14663
DS1 = CMP-007-00014-2: Manufacturer: Avago; Colour: Red; Nominal Vf: 1.8V; Luminous Intensity: 17mcd; Power: 78mW; Forward Current: 20mA; Lens Style: Diffused; Viewing Angle: 170degrees; Package Quantity: 4000; Manufacturer URL: http://www.avagotech.com/; Min Operating Temperature: -40°C; Datasheet URL: http://docs.avagotech.com/docs/AV02-0551EN; RoHS Compliant: True; Forward Voltage: 1.8V; Pins: 2; Max Operating Temperature: 85°C; Packaging: TapeandReel; Package Reference: HSMX-C190; Datasheet Version: Mar-12; Package Description: 2-Pin Surface Mount Device, Body 1.6 x 0.8 mm, Height 0.9 mm; Case/Package: 0603; Mounting Technology: SM; Illumination Colour: Red; LCSC: C2286
J2 = TYPE-C-31-M-12: USB Connectors 24 Receptacle 1 8.94*7.3mm RoHS; MF: HRO Electronics Co., Ltd.; SnapEDA_Link: https://www.snapeda.com/parts/TYPE-C-31-M-12/HRO+Electronics+Co.%252C+Ltd./view-part/?ref=snap; Package: Package; Value: *; MP: TYPE-C-31-M-12; Check_prices: https://www.snapeda.com/parts/TYPE-C-31-M-12/HRO+Electronics+Co.%252C+Ltd./view-part/?ref=eda
R11-R13 = CMP-009-00031-5: 0603; Tolerance: 1%; Power: 100mW; Mounting Technology: SM; Case/Package: 0603; RoHS Compliant: True; Pins: 2; Min Operating Temperature: -55°C; Max Operating Temperature: 155°C
  R11 R12: Value: 5.1k; LCSC: C23186
  R13: Value: 1k; LCSC: C21190
U3 = USBLC6-2SC6: 17V Clamp 5A (8/20Âµs) Ipp Tvs Diode Surface Mount SOT-23-6; MF: STMicroelectronics; Value: *; SnapEDA_Link: https://www.snapeda.com/parts/USBLC6-2SC6/STMicroelectronics/view-part/?ref=snap; Check_prices: https://www.snapeda.com/parts/USBLC6-2SC6/STMicroelectronics/view-part/?ref=eda; Purchase-URL: https://pricing.snapeda.com/search/part/USBLC6-2SC6/?ref=eda; Price: None; Availability: In Stock; Package: SOT-23-6 STMicroelectronics; MP: USBLC6-2SC6; LCSC: C7519

## Nets that join several sheets
GND: BYTE_SPIne (34 pins), CAN_B3 (30 pins), CAN_B4 (30 pins), CAN_A1 (30 pins), CAN_A2 (30 pins), USB_Communication (12 pins)
3V3: BYTE_SPIne (C21.2 TP1.1 U5.2 U5.4), CAN_B3 (18 pins), CAN_B4 (18 pins), CAN_A1 (18 pins), CAN_A2 (18 pins)
5V: BYTE_SPIne (6 pins), CAN_B3 (C1_CAN_B3.1 C2_CAN_B3.1 U2_CAN_B3.3), CAN_B4 (C1_CAN_B4.1 C2_CAN_B4.1 U2_CAN_B4.3), CAN_A1 (C1_CAN_A1.1 C2_CAN_A1.1 U2_CAN_A1.3), CAN_A2 (C1_CAN_A2.1 C2_CAN_A2.1 U2_CAN_A2.3)
+5VUSB: BYTE_SPIne (C25.2 TP4.1 U6.3 U7.1), USB_Communication (6 pins)
NetU3_1: BYTE_SPIne (U4.10), USB_Communication (U3.1)
NetU3_3: BYTE_SPIne (U4.9), USB_Communication (U3.3)
SPI0_MISO: BYTE_SPIne (P2.21), CAN_A1 (R4_CAN_A1.2), CAN_A2 (R4_CAN_A2.2)
SPI0_MOSI: BYTE_SPIne (P2.19), CAN_A1 (U1_CAN_A1.28), CAN_A2 (U1_CAN_A2.28)
SPI0_SCK: BYTE_SPIne (R18.1), CAN_A1 (U1_CAN_A1.26), CAN_A2 (U1_CAN_A2.26)
SPI1_MISO: BYTE_SPIne (P2.22), CAN_B3 (R4_CAN_B3.2), CAN_B4 (R4_CAN_B4.2)
SPI1_MOSI: BYTE_SPIne (P2.37), CAN_B3 (U1_CAN_B3.28), CAN_B4 (U1_CAN_B4.28)
SPI1_SCK: BYTE_SPIne (R17.1), CAN_B3 (U1_CAN_B3.26), CAN_B4 (U1_CAN_B4.26)
SPI_INT1: BYTE_SPIne (P2.29), CAN_A1 (U1_CAN_A1.22)
SPI_INT2: BYTE_SPIne (P2.31), CAN_A2 (U1_CAN_A2.22)
SPI_INT3: BYTE_SPIne (P2.32), CAN_B3 (U1_CAN_B3.22)
SPI_INT4: BYTE_SPIne (P2.33), CAN_B4 (U1_CAN_B4.22)
SPI_NSS1: BYTE_SPIne (P2.24), CAN_A1 (R3_CAN_A1.1 U1_CAN_A1.25)
SPI_NSS2: BYTE_SPIne (P2.26), CAN_A2 (R3_CAN_A2.1 U1_CAN_A2.25)
SPI_NSS3: BYTE_SPIne (P2.18), CAN_B3 (R3_CAN_B3.1 U1_CAN_B3.25)
SPI_NSS4: BYTE_SPIne (P2.16), CAN_B4 (R3_CAN_B4.1 U1_CAN_B4.25)
USB_DM1: BYTE_SPIne (U4.7), CAN_A1 (U1_CAN_A1.32)
USB_DM2: BYTE_SPIne (U4.5), CAN_A2 (U1_CAN_A2.32)
USB_DM3: BYTE_SPIne (U4.3), CAN_B3 (U1_CAN_B3.32)
USB_DM4: BYTE_SPIne (U4.1), CAN_B4 (U1_CAN_B4.32)
USB_DP1: BYTE_SPIne (U4.8), CAN_A1 (U1_CAN_A1.33)
USB_DP2: BYTE_SPIne (U4.6), CAN_A2 (U1_CAN_A2.33)
USB_DP3: BYTE_SPIne (U4.4), CAN_B3 (U1_CAN_B3.33)
USB_DP4: BYTE_SPIne (U4.2), CAN_B4 (U1_CAN_B4.33)